# EasyEDA Pro project EVA_RT.eprj, schematic Footprint_Rule
Board Name: #6_Regla; Create Date: 2025-01-23; Page Name: P1; Project Name: EVA-RT; Schematic Name: Regla; Update Date: 2025-01-23; Company: EasyEDA.com; Drawn: EasyEDA; Page Size: A4; Part Number: JLCPCB-002; Reviewed: EasyEDA; Version: V0.1
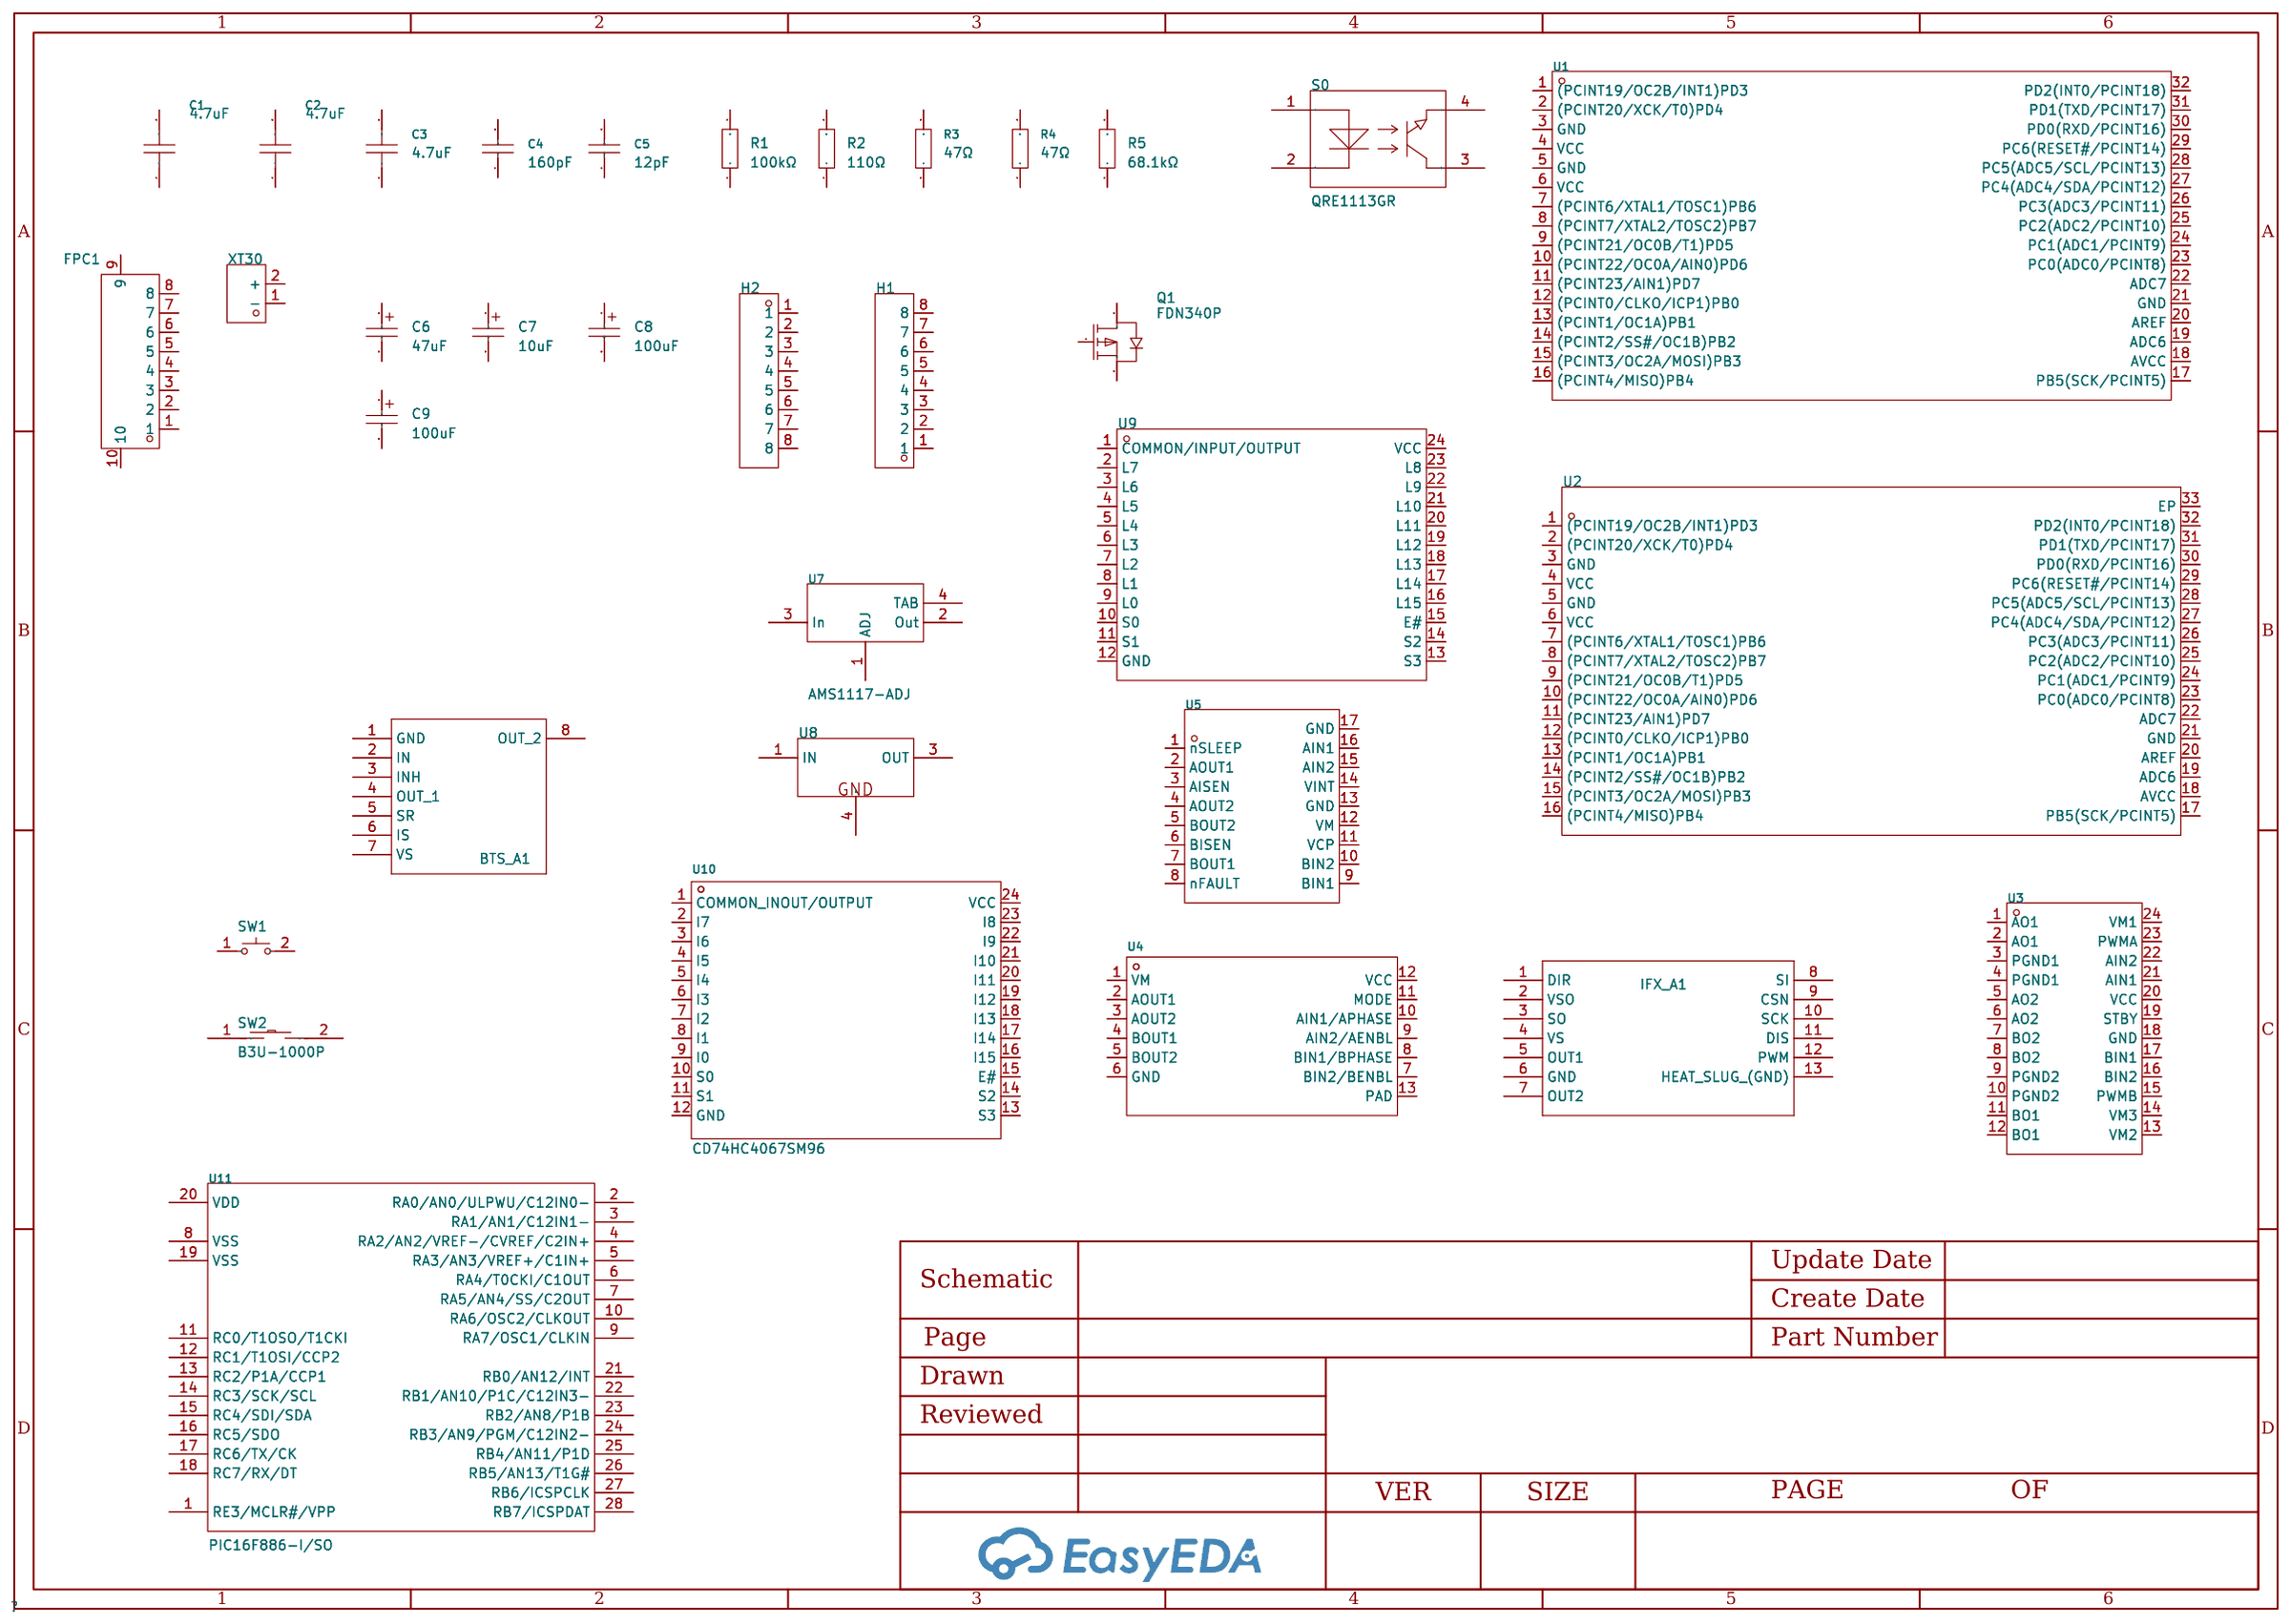
[diagram p3: schematic sheet]

## Parts
BTS_A1  -  [BTS7960B]
C1  4.7uF  [C1206]
C2  4.7uF  [C0805]
C3  4.7uF  [C0603]
C4  160pF  [C0402]
C5  12pF  [C0201]
C6  47uF  [CAP-SMD_L3.2-W1.6-RD]
C7  10uF  [CAP-SMD_L3.5-W2.8-R-RD]
C8  100uF  [CAP-SMD_L6.0-W3.2-R-RD]
C9  100uF  [CAP-SMD_L7.3-W4.3-R-RD]
FPC1  FFC05001-08SBA124W5M  [FFC-SMD_FFC05001-08SBA124W5M]
H1  PZ254-1-08-Z-8.5  [HDR-TH_8P-P2.54-V-M]
H2  KH-1.27PH180-1X8P-L7.2  [HDR-TH_8P-P1.27-V-M]
IFX_A1  -  [PG-DSO-12-17]
Q1  FDN340P  [SOT-23-3_L2.9-W1.3-P1.90-LS2.4-BR]
R1  100kΩ  [R1206]
R2  110Ω  [R0805]
R3  47Ω  [R0603]
R4  47Ω  [R0402]
R5  68.1kΩ  [R0201]
S0  QRE1113GR  [OPTO-SMD_QRE1113GR]
SW1  TS-1101A-C-R  [SW-SMD_L6.00-W3.60-LS6.0]
SW2  B3U-1000P  [KEY-SMD_B3U-1000PM]
U1  ATMEGA328P-AU  [TQFP-32_L7.0-W7.0-P0.80-LS9.0-BL]
U2  ATMEGA328P-MN  [VQFN-32_L5.0-W5.0-P0.50-TL-EP3.1]
U3  TB6612FNG(O,C,8,EL  [SSOP-24_L8.4-W5.8-P0.65-LS7.8-BL]
U4  DRV8835DSSR  [WSON-12_L3.0-W2.0-P0.50-BL-EP]
U5  DRV8833PWP  [ETSSOP-16_L5.0-W4.4-P0.65-LS6.4-BL-EP]
U7  AMS1117-ADJ  [SOT-223_L6.7-W3.5-P2.30-BR]
U8  78M05  [TO-252-2_L6.5-W6.1-P4.58-LS10.0-TL]
U9  CD74HC4067M  [SOIC-24_L15.4-W7.5-P1.27-LS10.3-BL]
U10  CD74HC4067SM96  [SSOP-24_L8.1-W5.3-P0.65-LS7.8-BL]
U11  PIC16F886-I/SO  [SOIC-28_L17.9-W7.5-P1.27-LS10.3-BL]
XT30  XT30UPB-M  [CONN-TH_XT30UPB-M]

## Library data of the parts
BTS_A1 = BTS7960B_
C1 = 1206F475Z160CT: Capacitance: Tolerance:-20%~+80% Tolerance:-20%~+80% Voltage Rated: Temperature Coefficient:; LCSC Part Name: 4.7uF -20%~+80% 16V; Supplier Part: C303965; Manufacturer: Walsin(华新科); Supplier Footprint: 1206; JLCPCB Part Class: Extended Part; Datasheet: https://atta.szlcsc.com/upload/public/pdf/source/20191217/C469650_84AD5C6F618CF4AC0C6D987F2E8FE6F8.pdf; Supplier: LCSC; Tolerance: -20%~+80%
C2 = CL21A475KACLRNC: Capacitance: Tolerance:±10% Tolerance:±10% Voltage Rated: Temperature Coefficient:; LCSC Part Name: 4.7uF ±10% 25V; Supplier Part: C318689; Manufacturer: SAMSUNG(三星); Supplier Footprint: 0805; JLCPCB Part Class: Extended Part; Datasheet: https://atta.szlcsc.com/upload/public/pdf/source/20160218/1457707763339.pdf; Supplier: LCSC; Tolerance: ±10%
C3 = CL10A475MP5LNNC: Capacitance: Tolerance:±20% Tolerance:±20% Voltage Rated: Temperature Coefficient:; LCSC Part Name: 4.7uF ±20% 10V; Supplier Part: C318644; Manufacturer: SAMSUNG(三星); Supplier Footprint: 0603; JLCPCB Part Class: Extended Part; Datasheet: https://atta.szlcsc.com/upload/public/pdf/source/20190807/C318644_F171FADF1B72660198A02802C106D351.pdf; Supplier: LCSC; Tolerance: ±20%
C4 = 0402B161K500NT: Capacitance: Tolerance:±10% Tolerance:±10% Voltage Rated: Temperature Coefficient:; LCSC Part Name: 160pF ±10% 50V; Supplier Part: C1528; Manufacturer: FH(风华); Supplier Footprint: 0402; JLCPCB Part Class: Extended Part; Datasheet: https://atta.szlcsc.com/upload/public/pdf/source/20200305/C486355_26A10D38EF8C2A5C37091D0039909270.pdf; Supplier: LCSC; Tolerance: ±10%
C5 = 0201CG120J500NT: Capacitance: Tolerance:±5% Tolerance:±5% Voltage Rated: Temperature Coefficient:; LCSC Part Name: 12pF ±5% 50V; Supplier Part: C50391; Manufacturer: FH(风华); Supplier Footprint: 0201; JLCPCB Part Class: Extended Part; Datasheet: https://atta.szlcsc.com/upload/public/pdf/source/20200305/C486355_26A10D38EF8C2A5C37091D0039909270.pdf; Supplier: LCSC; Tolerance: ±5%
C6 = TC212A476K006Y: Capacitance: Tolerance:±10% Tolerance:±10% Rated Voltage: Equivalent Series Resistance(ESR):2.5Ω@100kHz Operating Temperature:-55℃~+125℃ Operating Temperature:-55℃~+125℃; LCSC Part Name: 47uF ±10% 6.3V; Supplier Part: C108525; Manufacturer: Sunlord(顺络); Supplier Footprint: CASE-A-3216; JLCPCB Part Class: Extended Part; Datasheet: https://atta.szlcsc.com/upload/public/pdf/source/20231030/DDA5D10C6B7FCAF98AC7C23C2BD0B0CB.pdf; Supplier: LCSC; Tolerance: ±10%; Equivalent Series Resistance(ESR): 2.5Ω@100kHz; Operating Temperature: -55℃~+125℃
C7 = TAJB106M025RNJ: Capacitance: Tolerance:±20% Tolerance:±20% Rated Voltage: Equivalent Series Resistance(ESR):2.5Ω@100kHz Operating Temperature:-55℃~+125℃ Operating Temperature:-55℃~+125℃; LCSC Part Name: 10uF ±20% 25V; Supplier Part: C8018; Manufacturer: Kyocera AVX; Supplier Footprint: CASE-B-3528; JLCPCB Part Class: Extended Part; Datasheet: https://atta.szlcsc.com/upload/public/pdf/source/20160107/1457707750344.pdf; Supplier: LCSC; Tolerance: ±20%; Equivalent Series Resistance(ESR): 2.5Ω@100kHz; Operating Temperature: -55℃~+125℃
C8 = TAJC107M010RNJ: Capacitance: Tolerance:±20% Tolerance:±20% Rated Voltage: Equivalent Series Resistance(ESR):1.2Ω@100kHz Operating Temperature:-55℃~+125℃ Operating Temperature:-55℃~+125℃; LCSC Part Name: 100uF ±20% 10V; Supplier Part: C8022; Manufacturer: Kyocera AVX; Supplier Footprint: CASE-C-6032; JLCPCB Part Class: Extended Part; Datasheet: https://atta.szlcsc.com/upload/public/pdf/source/20160107/1457707750344.pdf; Supplier: LCSC; Tolerance: ±20%; Equivalent Series Resistance(ESR): 1.2Ω@100kHz; Operating Temperature: -55℃~+125℃
C9 = TAJD107M020RNJ: Capacitance: Tolerance:±20% Tolerance:±20% Rated Voltage: Equivalent Series Resistance(ESR):500mΩ@100kHz Operating Temperature:-55℃~+125℃ Operating Temperature:-55℃~+125℃; LCSC Part Name: 100uF ±20% 20V; Supplier Part: C99373; Manufacturer: Kyocera AVX; Supplier Footprint: CASE-D-7343; JLCPCB Part Class: Extended Part; Datasheet: https://atta.szlcsc.com/upload/public/pdf/source/20180227/C182558_15197019548181370714.pdf; Supplier: LCSC; Tolerance: ±20%; Equivalent Series Resistance(ESR): 500mΩ@100kHz; Operating Temperature: -55℃~+125℃
FPC1 = FFC05001-08SBA124W5M: Locking Feature:抽屉式 Contact Type:Contact,Top Number of Contacts:8P Pitch:0.5mm Mounting Type:卧贴 FFC, FCB Thickness:0.3mm FFC, FCB Thickness:0.3mm Height Above Board:2mm; LCSC Part Name: 间距:0.5mm P数:8P 抽屉式 上接; Supplier Part: C456419; Manufacturer: TXGA(特思嘉); Supplier Footprint: SMD,P=0.5mm,卧贴; JLCPCB Part Class: Extended Part; Datasheet: https://atta.szlcsc.com/upload/public/pdf/source/20191118/C456760_2EA6D213D04401C3F6010DA75CB9EC31.pdf; Supplier: LCSC; Locking Feature: 抽屉式; Contact Type: Contact,Top; Number of Contacts: 8P; Pitch: 0.5mm; Mounting Type: 卧贴; FFC, FCB Thickness: 0.3mm; Height Above Board: 2mm
H1 = PZ254-1-08-Z-8.5: Pin Structure:1x8P Pitch:2.54mm Row Spacing:- Circluar Pins/Square Pins:Square Pins Mounting Type:Straight Number of Rows:Plugin Number of Pins:8P Current Rating (Max):3A Voltage Rating (Max):- Length of Mating Pin:6mm Insulation Height:2.5mm Length of En; LCSC Part Name: 间距:2.54mm 1x8P 直插 方针; Supplier Part: C2894931; Manufacturer: HCTL(华灿天禄); Supplier Footprint: 插件,P=2.54mm; JLCPCB Part Class: Extended Part; Datasheet: https://atta.szlcsc.com/upload/public/pdf/source/20230609/805D25CEF03592837AF6F506EEB5ED41.pdf; Supplier: LCSC; Pin Structure: 1x8P; Pitch: 2.54mm; Circluar Pins/Square Pins: Square Pins; Mounting Type: Straight; Number of Rows: Plugin; Number of Pins: 8P; Current Rating (Max): 3A; Length of Mating Pin: 6mm; Insulation Height: 2.5mm; Length of End Connection Pin: 3mm; Operating Temperature Range: -40℃~+105℃; Color: Black
H2 = KH-1.27PH180-1X8P-L7.2: Pin Structure:1x8P Pitch:1.27mm Row Spacing:- Circluar Pins/Square Pins:Square Pins Mounting Type:Straight Number of Rows:Plugin Number of Pins:8P Current Rating (Max):1A Voltage Rating (Max):- Length of Mating Pin:3.9mm Insulation Height:1mm Length of En; LCSC Part Name: 间距:1.27mm 1x8P 直插 方针; Supplier Part: C2938403; Manufacturer: kinghelm(金航标); Supplier Footprint: 插件,P=1.27mm; JLCPCB Part Class: Extended Part; Datasheet: https://atta.szlcsc.com/upload/public/pdf/source/20211228/95E94E1D1651E755577FB869EFE6576E.pdf; Supplier: LCSC; Pin Structure: 1x8P; Pitch: 1.27mm; Circluar Pins/Square Pins: Square Pins; Mounting Type: Straight; Number of Rows: Plugin; Number of Pins: 8P; Current Rating (Max): 1A; Length of Mating Pin: 3.9mm; Insulation Height: 1mm; Length of End Connection Pin: 2.3mm; Operating Temperature Range: -40℃~+105℃
IFX_A1 = IFX9201SGAUMA1_
Q1 = FDN340P: Supplier Part: C2890122; Manufacturer: TECH PUBLIC(台舟); Supplier Footprint: SOT-23; JLCPCB Part Class: Extended Part; Datasheet: https://atta.szlcsc.com/upload/public/pdf/source/20210903/3458D4EFB17228716B6B26FC4AFCE66E.pdf; Supplier: LCSC
R1 = RMS12JT104: Type:Thick Film Resistors Resistance: Tolerance:±5% Tolerance:±5% Power(Watts): Overload Voltage (Max): Temperature Coefficient:±200ppm/℃ Temperature Coefficient:±200ppm/℃ Operating Temperature Range:-55℃~+155℃ Operating Temperature Range:-55℃~+155℃; LCSC Part Name: 厚膜电阻 100kΩ ±5% 250mW; Supplier Part: C212555; Manufacturer: 大毅科技; Supplier Footprint: 1206; JLCPCB Part Class: Extended Part; Datasheet: https://atta.szlcsc.com/upload/public/pdf/source/20190313/C209057_DB28D2F9A2E1A0AF6BB7AAA99A28D7CC.pdf; Supplier: LCSC; Type: Thick Film Resistors; Tolerance: ±5%; Temperature Coefficient: ±200ppm/℃; Operating Temperature Range: -55℃~+155℃
R2 = RS-05K111JT: Resistance: Tolerance:±5% Tolerance:±5% Power(Watts): Temperature Coefficient:±100ppm/℃ Temperature Coefficient:±100ppm/℃ Overload Voltage (Max): Operating Temperature Range:-55℃~+155℃ Operating Temperature Range:-55℃~+155℃; LCSC Part Name: 110Ω ±5% 125mW; Supplier Part: C1335; Manufacturer: FH(风华); Supplier Footprint: 0805; JLCPCB Part Class: Extended Part; Datasheet: https://atta.szlcsc.com/upload/public/pdf/source/20140224/1457706838103.pdf; Supplier: LCSC; Tolerance: ±5%; Temperature Coefficient: ±100ppm/℃; Operating Temperature Range: -55℃~+155℃
R3 = 0603WAJ0470T5E: Type:Thick Film Resistors Resistance: Tolerance:±5% Tolerance:±5% Power(Watts): Overload Voltage (Max): Temperature Coefficient:±200ppm/℃ Temperature Coefficient:±200ppm/℃ Operating Temperature Range:-55℃~+155℃ Operating Temperature Range:-55℃~+155℃; LCSC Part Name: 47Ω ±5% 100mW 厚膜电阻; Supplier Part: C1211; Manufacturer: UNI-ROYAL(厚声); Supplier Footprint: 0603; JLCPCB Part Class: Extended Part; Datasheet: https://atta.szlcsc.com/upload/public/pdf/source/20200306/C422600_1E6D84923E4A46A82E41ADD87F860B5C.pdf; Supplier: LCSC; Type: Thick Film Resistors; Tolerance: ±5%; Temperature Coefficient: ±200ppm/℃; Operating Temperature Range: -55℃~+155℃
R4 = RC-02W470JT: Type:Thick Film Resistors Resistance: Tolerance:±5% Tolerance:±5% Power(Watts): Overload Voltage (Max): Temperature Coefficient:±200ppm/℃ Temperature Coefficient:±200ppm/℃ Operating Temperature Range:-55℃~+155℃ Operating Temperature Range:-55℃~+155℃; LCSC Part Name: 47Ω ±5% 62.5mW; Supplier Part: C1096; Manufacturer: FH(风华); Supplier Footprint: 0402; JLCPCB Part Class: Extended Part; Datasheet: https://atta.szlcsc.com/upload/public/pdf/source/20140616/1457707091974.pdf; Supplier: LCSC; Type: Thick Film Resistors; Tolerance: ±5%; Temperature Coefficient: ±200ppm/℃; Operating Temperature Range: -55℃~+155℃
R5 = RC0201FR-0768K1L: Type:Thick Film Resistors Resistance: Tolerance:±1% Tolerance:±1% Power(Watts): Overload Voltage (Max): Temperature Coefficient:±200ppm/℃ Temperature Coefficient:±200ppm/℃ Operating Temperature Range:-55℃~+125℃ Operating Temperature Range:-55℃~+125℃; LCSC Part Name: 厚膜电阻 68.1kΩ ±1% 50mW; Supplier Part: C77620; Manufacturer: YAGEO(国巨); Supplier Footprint: 0201; JLCPCB Part Class: Extended Part; Datasheet: https://atta.szlcsc.com/upload/public/pdf/source/20180821/C275644_0D56F95EFF785E7D9A1FEF436B37DA78.pdf; Supplier: LCSC; Type: Thick Film Resistors; Tolerance: ±1%; Temperature Coefficient: ±200ppm/℃; Operating Temperature Range: -55℃~+125℃
S0 = QRE1113GR: Supplier Part: C232862; Manufacturer: onsemi(安森美); Supplier Footprint: SMD-4P; JLCPCB Part Class: Extended Part; Datasheet: https://atta.szlcsc.com/upload/public/pdf/source/20221020/4EA8EB874547A092CF9AAECC2DF94CC1.pdf; Supplier: LCSC
SW1 = TS-1101A-C-R: Circuit:SPST Actuator Style:Rectangle button Operating Force:260gf Mounting Style:Standing paste Switch Length:6mm Switch Width:3.6mm Switch Height:2.5mm Strike Gundam:Without Contact Current:50mA Voltage Rating (DC):12V Insulation Resistance:- Actuator/C; LCSC Part Name: 6*3.6*2.5mm 立贴 轻触开关; Supplier Part: C388638; Manufacturer: XKB Connection(中国星坤); Supplier Footprint: SMD; JLCPCB Part Class: Extended Part; Datasheet: https://atta.szlcsc.com/upload/public/pdf/source/20211015/FB820AB85B64273C1A496D9A04A54222.pdf; Supplier: LCSC; Circuit: SPST; Actuator Style: Rectangle button; Operating Force: 260gf; Mounting Style: Standing paste; Switch Length: 6mm; Switch Width: 3.6mm; Switch Height: 2.5mm; Strike Gundam: Without; Contact Current: 50mA; Voltage Rating (DC): 12V; Actuator/Cap Color: Brown; With Lamp: None; Mechanical Life: 100000 Times; Operating Temperature: -30℃~+85℃
SW2 = B3U-1000P_C231329: Circuit:SPST Actuator Style:Round Button Operating Force:153gf Mounting Style:Brick nogging Switch Length:3mm Switch Width:2.5mm Switch Height:1.6mm Contact Current:50mA Voltage Rating (DC):12V With Lamp:- Pin Style:SMDSplicing Mechanical Life:- Operating; LCSC Part Name: 3*2.5*1.6mm 立贴 轻触开关; Supplier Part: C231329; Manufacturer: OMRON(欧姆龙); Supplier Footprint: SMD,2.5x3mm; JLCPCB Part Class: Extended Part; Supplier: LCSC; Circuit: SPST; Actuator Style: Round Button; Operating Force: 153gf; Mounting Style: Brick nogging; Switch Length: 3mm; Switch Width: 2.5mm; Switch Height: 1.6mm; Contact Current: 50mA; Voltage Rating (DC): 12V; Pin Style: SMDSplicing; Operating Temperature: -25℃~+70℃
U1 = ATMEGA328P-AU_C14877: Application Area:- CPU Core:AVR CPU Maximum Speed:20MHz Operating Voltage Range:1.8V~5.5V Operating Voltage Range:1.8V~5.5V Program Storage Size:32KB Program Memory Type:FLASH RAM Size:2KB EEPROM:1KB GPIO Ports Number:23 ADC (Bit):10bit DAC (Bit):- PWM (B; Supplier Part: C14877; Manufacturer: MICROCHIP(美国微芯); Supplier Footprint: TQFP-32(7x7); JLCPCB Part Class: Basic Part; Datasheet: https://atta.szlcsc.com/upload/public/pdf/source/20140621/1457707095197.pdf; Supplier: LCSC; CPU Core: AVR; CPU Maximum Speed: 20MHz; Operating Voltage Range: 1.8V~5.5V; Program Storage Size: 32KB; Program Memory Type: FLASH; RAM Size: 2KB; EEPROM: 1KB; GPIO Ports Number: 23; ADC (Bit): 10bit; Peripheral/Function: WDT；PWM；WDT；PWM; Watchdog: 有; Low-Voltage Detect: 有; Internal Oscillator: 有; Operating Temperature Range: -40℃~+85℃
U2 = ATMEGA328P-MN: CPU Core:AVR Program Storage Size:16KB GPIO Ports Number:23 Operating Voltage Range:1.8V~5.5V Operating Voltage Range:1.8V~5.5V CPU Maximum Speed:20MHz Program Memory Type:FLASH Operating Temperature Range:-40℃~+105℃ Operating Temperature Range:-40℃~+105℃; LCSC Part Name: 基于AVR增强型RISC架构的低功耗CMOS 8位微控制器; Supplier Part: C1337395; Manufacturer: MICROCHIP(美国微芯); Supplier Footprint: VQFN-32-EP(5x5); JLCPCB Part Class: Extended Part; Datasheet: https://atta.szlcsc.com/upload/public/pdf/source/20210601/C1337395_360CDFC0D0A21951E0760A203B463B31.pdf; Supplier: LCSC; CPU Core: AVR; Program Storage Size: 16KB; GPIO Ports Number: 23; Operating Voltage Range: 1.8V~5.5V; CPU Maximum Speed: 20MHz; Program Memory Type: FLASH; Operating Temperature Range: -40℃~+105℃; ADC (Bit): 10bit; Peripheral/Function: PWM; Internal Oscillator: 有
U3 = TB6612FNG(O,C,8,EL: Supplier Part: C88224; Manufacturer: TOSHIBA(东芝); Supplier Footprint: SSOP-24-208mil; JLCPCB Part Class: Extended Part; Datasheet: https://atta.szlcsc.com/upload/public/pdf/source/20171128/C141517_15118625624231147036.pdf; Supplier: LCSC
U4 = DRV8835DSSR: Supplier Part: C129328; Manufacturer: TI(德州仪器); Supplier Footprint: WSON-12-EP(2x3); JLCPCB Part Class: Extended Part; Datasheet: https://www.ti.com/cn/lit/gpn/drv8835; Supplier: LCSC
U5 = DRV8833PWP: Drive motor type:有刷直流电机 Supply Voltage:2.7V~10.8V Supply Voltage:2.7V~10.8V Output Current:1.5A Interface:PWM Operating Temperature:-40℃~+150℃@(Tj) Operating Temperature:-40℃~+150℃@(Tj); LCSC Part Name: 1.5A 有刷直流电机驱动芯片 10.8V; Supplier Part: C1556089; Manufacturer: TI(德州仪器); Supplier Footprint: ETSSOP-16-EP; JLCPCB Part Class: Extended Part; Datasheet: https://www.ti.com/cn/lit/gpn/drv8833; Supplier: LCSC; Drive motor type: 有刷直流电机; Supply Voltage: 2.7V~10.8V; Output Current: 1.5A; Interface: PWM; Operating Temperature: -40℃~+150℃@(Tj)
U7 = AMS1117-ADJ_C6188: Output Type: Maximum Input Voltage:15V Output Voltage:1.25V~11.75V Output Voltage:1.25V~11.75V MAX Output Current:800mA Power Supply Rejection Ratio (PSRR):75dB@(120Hz) Dropout Voltage:1.3V@(800mA) Output Polarity:Positive electrode Number of Outputs:1; LCSC Part Name: ADJ 输入15V 输出1.25V~11.75V 800mA; Supplier Part: C6188; Manufacturer: AMS; Supplier Footprint: SOT-223; JLCPCB Part Class: Extended Part; Datasheet: https://atta.szlcsc.com/upload/public/pdf/source/20120416/1457706470730.pdf; Supplier: LCSC; Maximum Input Voltage: 15V; Output Voltage: 1.25V~11.75V; MAX Output Current: 800mA; Power Supply Rejection Ratio (PSRR): 75dB@(120Hz); Dropout Voltage: 1.3V@(800mA); Output Polarity: Positive electrode; Number of Outputs: 1
U8 = 78M05_C111265: Output Type: Output Polarity:Positive Number of Outputs:1 Maximum Input Voltage:35V Output Voltage:5V~5V Output Voltage:5V~5V Dropout Voltage:2V@(500mA) Output Current:500mA Power Supply Rejection Ratio (PSRR):78dB@(120Hz); LCSC Part Name: 输入35V 输出5V 500mA; Supplier Part: C111265; Manufacturer: SHIKUES(时科); Supplier Footprint: TO-252-2(DPAK); JLCPCB Part Class: Extended Part; Datasheet: https://atta.szlcsc.com/upload/public/pdf/source/20170508/1494209360971.pdf; Supplier: LCSC; Output Polarity: Positive; Number of Outputs: 1; Maximum Input Voltage: 35V; Output Voltage: 5V~5V; Dropout Voltage: 2V@(500mA); Output Current: 500mA; Power Supply Rejection Ratio (PSRR): 78dB@(120Hz)
U9 = CD74HC4067M: Switch Circuit:- Number of Channels:1 Supply Voltage:2V~6V Supply Voltage:2V~6V Turn-on time:51ns On-State Resistance (Max):160Ω Turn-off time:49ns; Supplier Part: C1545936; Manufacturer: TI(德州仪器); Supplier Footprint: SOIC-24-300mil; JLCPCB Part Class: Extended Part; Datasheet: https://www.ti.com/cn/lit/gpn/cd74hct4067; Supplier: LCSC; Number of Channels: 1; Supply Voltage: 2V~6V; Turn-on time: 51ns; On-State Resistance (Max): 160Ω; Turn-off time: 49ns
U10 = CD74HC4067SM96: Switch Circuit:-; Supplier Part: C98457; Manufacturer: TI(德州仪器); Supplier Footprint: SSOP-24-208mil; JLCPCB Part Class: Extended Part; Datasheet: https://www.ti.com/cn/lit/gpn/cd74hc4067; Supplier: LCSC
U11 = PIC16F886-I/SO: CPU Core:PIC Program Storage Size:14KB RAM Size:368Byte GPIO Ports Number:24 Operating Voltage Range:2V~5.5V Operating Voltage Range:2V~5.5V CPU Maximum Speed:20MHz Program Memory Type:FLASH EEPROM:256Byte Operating Temperature Range:-40℃~+85℃ Operating T; Supplier Part: C40447; Manufacturer: MICROCHIP(美国微芯); Supplier Footprint: SOIC-28-300mil; JLCPCB Part Class: Extended Part; Datasheet: https://atta.szlcsc.com/upload/public/pdf/source/20150407/1457707276738.pdf; Supplier: LCSC; CPU Core: PIC; Program Storage Size: 14KB; RAM Size: 368Byte; GPIO Ports Number: 24; Operating Voltage Range: 2V~5.5V; CPU Maximum Speed: 20MHz; Program Memory Type: FLASH; EEPROM: 256Byte; Operating Temperature Range: -40℃~+85℃; ADC (Bit): 10bit; Peripheral/Function: WDT；PWM; Watchdog: 有; Low-Voltage Detect: 有; Internal Oscillator: 有
XT30 = XT30UPB-M: LCSC Part Name: AMASS(艾迈斯)板载立式 航模锂电池控制器连接器插头 公头XT30UPB-M; Supplier Part: C428721; Manufacturer: AMASS(艾迈斯); JLCPCB Part Class: Extended Part; Datasheet: https://atta.szlcsc.com/upload/public/pdf/source/20230412/7B5DFEF57C9EA5273853390C734B3AC5.pdf; Supplier: LCSC

## Nets

Not connected (* = marked no-connect by the designer): BTS_A1 1(GND) 2(IN) 3(INH) 4(OUT_1) 5(SR) 6(IS) 7(VS) 8(OUT_2); C1 1 2; C2 1 2; C3 1 2; C4 1 2; C5 1 2; C6 1 2; C7 1 2; C8 1 2; C9 1 2; FPC1 1 2 3 4 5 6 7 8 9 10; H1 1 2 3 4 5 6 7 8; H2 1 2 3 4 5 6 7 8; IFX_A1 1(DIR) 2(VSO) 3(SO) 4(VS) 5(OUT1) 6(GND) 7(OUT2) 8(SI) 9(CSN) 10(SCK) 11(DIS) 12(PWM) 13(HEAT_SLUG_(GND)); Q1 1(G) 2(S) 3(D); R1 1 2; R2 1 2; R3 1 2; R4 1 2; R5 1 2; S0 1 2 3 4; SW1 1 2; SW2 1 2; U1 1((PCINT19/OC2B/INT1)PD3) 2((PCINT20/XCK/T0)PD4) 3(GND) 4(VCC) 5(GND) 6(VCC) 7((PCINT6/XTAL1/TOSC1)PB6) 8((PCINT7/XTAL2/TOSC2)PB7) 9((PCINT21/OC0B/T1)PD5) 10((PCINT22/OC0A/AIN0)PD6) 11((PCINT23/AIN1)PD7) 12((PCINT0/CLKO/ICP1)PB0) 13((PCINT1/OC1A)PB1) 14((PCINT2/SS#/OC1B)PB2) 15((PCINT3/OC2A/MOSI)PB3) 16((PCINT4/MISO)PB4) 17(PB5(SCK/PCINT5)) 18(AVCC) 19(ADC6) 20(AREF) 21(GND) 22(ADC7) 23(PC0(ADC0/PCINT8)) 24(PC1(ADC1/PCINT9)) 25(PC2(ADC2/PCINT10)) 26(PC3(ADC3/PCINT11)) 27(PC4(ADC4/SDA/PCINT12)) 28(PC5(ADC5/SCL/PCINT13)) 29(PC6(RESET#/PCINT14)) 30(PD0(RXD/PCINT16)) 31(PD1(TXD/PCINT17)) 32(PD2(INT0/PCINT18)); U2 1((PCINT19/OC2B/INT1)PD3) 2((PCINT20/XCK/T0)PD4) 3(GND) 4(VCC) 5(GND) 6(VCC) 7((PCINT6/XTAL1/TOSC1)PB6) 8((PCINT7/XTAL2/TOSC2)PB7) 9((PCINT21/OC0B/T1)PD5) 10((PCINT22/OC0A/AIN0)PD6) 11((PCINT23/AIN1)PD7) 12((PCINT0/CLKO/ICP1)PB0) 13((PCINT1/OC1A)PB1) 14((PCINT2/SS#/OC1B)PB2) 15((PCINT3/OC2A/MOSI)PB3) 16((PCINT4/MISO)PB4) 17(PB5(SCK/PCINT5)) 18(AVCC) 19(ADC6) 20(AREF) 21(GND) 22(ADC7) 23(PC0(ADC0/PCINT8)) 24(PC1(ADC1/PCINT9)) 25(PC2(ADC2/PCINT10)) 26(PC3(ADC3/PCINT11)) 27(PC4(ADC4/SDA/PCINT12)) 28(PC5(ADC5/SCL/PCINT13)) 29(PC6(RESET#/PCINT14)) 30(PD0(RXD/PCINT16)) 31(PD1(TXD/PCINT17)) 32(PD2(INT0/PCINT18)) 33(EP); U3 1(AO1) 2(AO1) 3(PGND1) 4(PGND1) 5(AO2) 6(AO2) 7(BO2) 8(BO2) 9(PGND2) 10(PGND2) 11(BO1) 12(BO1) 13(VM2) 14(VM3) 15(PWMB) 16(BIN2) 17(BIN1) 18(GND) 19(STBY) 20(VCC) 21(AIN1) 22(AIN2) 23(PWMA) 24(VM1); U4 1(VM) 2(AOUT1) 3(AOUT2) 4(BOUT1) 5(BOUT2) 6(GND) 7(BIN2/BENBL) 8(BIN1/BPHASE) 9(AIN2/AENBL) 10(AIN1/APHASE) 11(MODE) 12(VCC) 13(PAD); U5 1(nSLEEP) 2(AOUT1) 3(AISEN) 4(AOUT2) 5(BOUT2) 6(BISEN) 7(BOUT1) 8(nFAULT) 9(BIN1) 10(BIN2) 11(VCP) 12(VM) 13(GND) 14(VINT) 15(AIN2) 16(AIN1) 17(GND); U7 1(ADJ) 2(Out) 3(In) 4(TAB); U8 1(IN) 3(OUT) 4(GND); U9 1(COMMON/INPUT/OUTPUT) 2(L7) 3(L6) 4(L5) 5(L4) 6(L3) 7(L2) 8(L1) 9(L0) 10(S0) 11(S1) 12(GND) 13(S3) 14(S2) 15(E#) 16(L15) 17(L14) 18(L13) 19(L12) 20(L11) 21(L10) 22(L9) 23(L8) 24(VCC); U10 1(COMMON INOUT/OUTPUT) 2(I7) 3(I6) 4(I5) 5(I4) 6(I3) 7(I2) 8(I1) 9(I0) 10(S0) 11(S1) 12(GND) 13(S3) 14(S2) 15(E#) 16(I15) 17(I14) 18(I13) 19(I12) 20(I11) 21(I10) 22(I9) 23(I8) 24(VCC); U11 1(RE3/MCLR#/VPP) 2(RA0/AN0/ULPWU/C12IN0-) 3(RA1/AN1/C12IN1-) 4(RA2/AN2/VREF-/CVREF/C2IN+) 5(RA3/AN3/VREF+/C1IN+) 6(RA4/T0CKI/C1OUT) 7(RA5/AN4/SS/C2OUT) 8(VSS) 9(RA7/OSC1/CLKIN) 10(RA6/OSC2/CLKOUT) 11(RC0/T1OSO/T1CKI) 12(RC1/T1OSI/CCP2) 13(RC2/P1A/CCP1) 14(RC3/SCK/SCL) 15(RC4/SDI/SDA) 16(RC5/SDO) 17(RC6/TX/CK) 18(RC7/RX/DT) 19(VSS) 20(VDD) 21(RB0/AN12/INT) 22(RB1/AN10/P1C/C12IN3-) 23(RB2/AN8/P1B) 24(RB3/AN9/PGM/C12IN2-) 25(RB4/AN11/P1D) 26(RB5/AN13/T1G#) 27(RB6/ICSPCLK) 28(RB7/ICSPDAT); XT30 1(-) 2(+)
